# Altium schematic sheet Opamp-Sheet2.SchDoc
size A4; DocumentNumber: 2; SheetNumber: 11; SheetTotal: 12
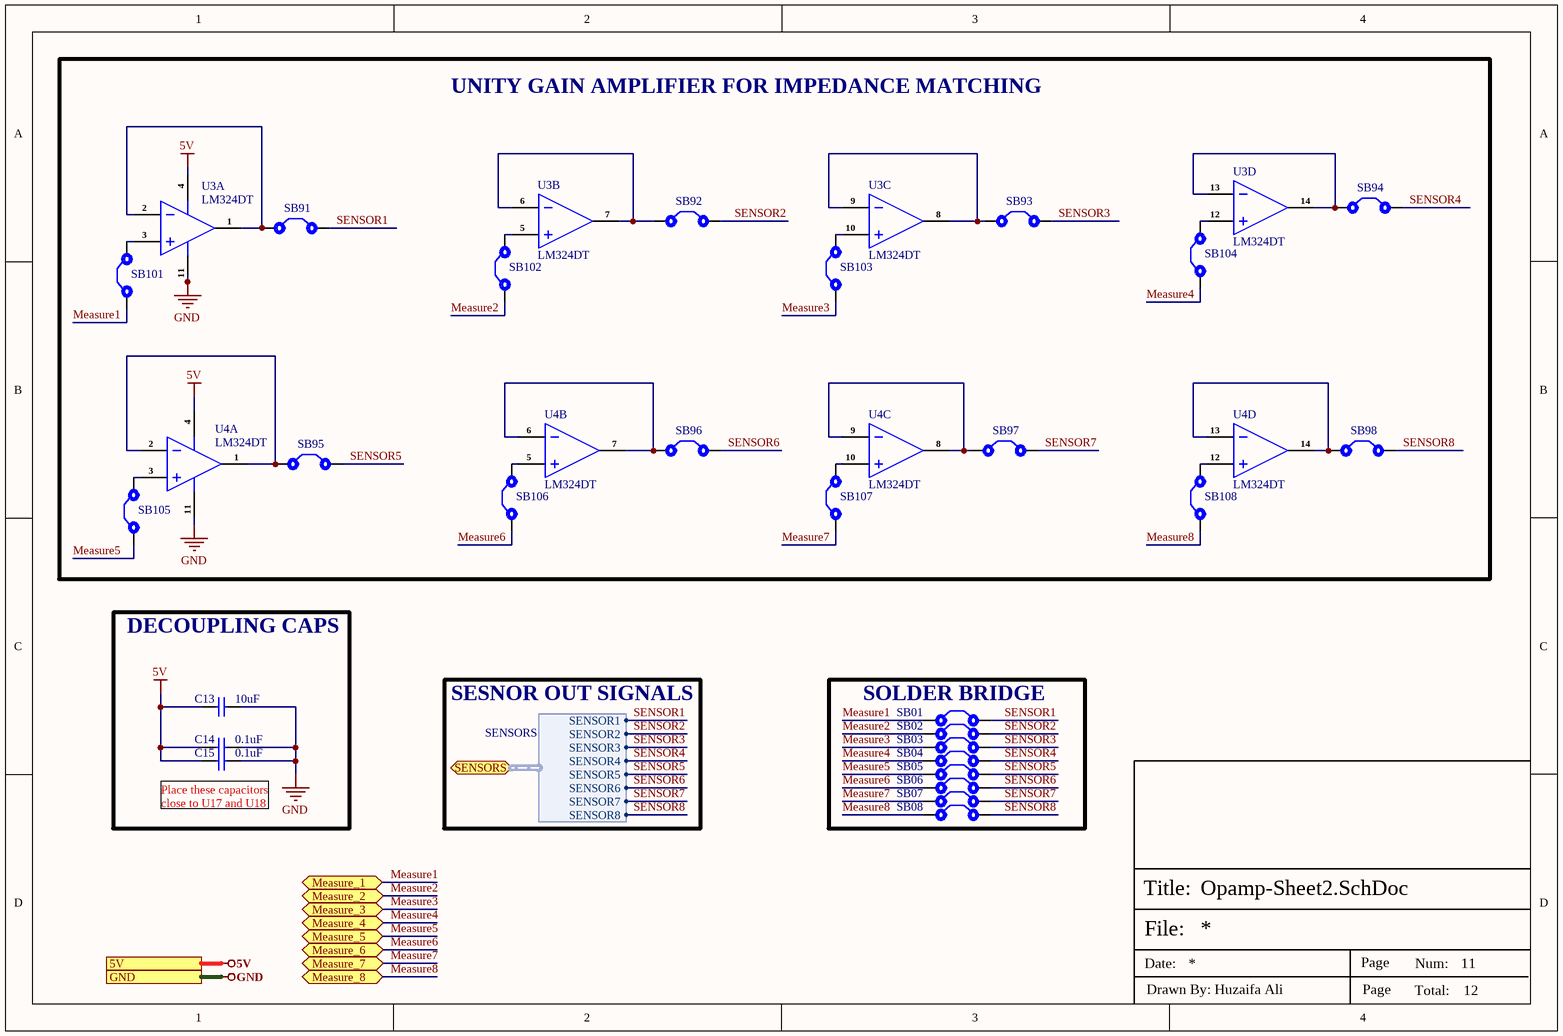
[diagram p0: Opamp-Sheet2.SchDoc]

## Parts
C13  10uF  [Cap-0603]
C14  0.1uF  [Cap-0402]
C15  0.1uF  [Cap-0402]
SB01  Solder Bridge 0402  [Solder Bridge 0402]  (value not drawn)  (no BOM)
SB02  Solder Bridge 0402  [Solder Bridge 0402]  (value not drawn)  (no BOM)
SB03  Solder Bridge 0402  [Solder Bridge 0402]  (value not drawn)  (no BOM)
SB04  Solder Bridge 0402  [Solder Bridge 0402]  (value not drawn)  (no BOM)
SB05  Solder Bridge 0402  [Solder Bridge 0402]  (value not drawn)  (no BOM)
SB06  Solder Bridge 0402  [Solder Bridge 0402]  (value not drawn)  (no BOM)
SB07  Solder Bridge 0402  [Solder Bridge 0402]  (value not drawn)  (no BOM)
SB08  Solder Bridge 0402  [Solder Bridge 0402]  (value not drawn)  (no BOM)
SB91  Solder Bridge 0402  [Solder Bridge 0402]  (value not drawn)  (no BOM)
SB92  Solder Bridge 0402  [Solder Bridge 0402]  (value not drawn)  (no BOM)
SB93  Solder Bridge 0402  [Solder Bridge 0402]  (value not drawn)  (no BOM)
SB94  Solder Bridge 0402  [Solder Bridge 0402]  (value not drawn)  (no BOM)
SB95  Solder Bridge 0402  [Solder Bridge 0402]  (value not drawn)  (no BOM)
SB96  Solder Bridge 0402  [Solder Bridge 0402]  (value not drawn)  (no BOM)
SB97  Solder Bridge 0402  [Solder Bridge 0402]  (value not drawn)  (no BOM)
SB98  Solder Bridge 0402  [Solder Bridge 0402]  (value not drawn)  (no BOM)
SB101  Solder Bridge 0402  [Solder Bridge 0402]  (value not drawn)  (no BOM)
SB102  Solder Bridge 0402  [Solder Bridge 0402]  (value not drawn)  (no BOM)
SB103  Solder Bridge 0402  [Solder Bridge 0402]  (value not drawn)  (no BOM)
SB104  Solder Bridge 0402  [Solder Bridge 0402]  (value not drawn)  (no BOM)
SB105  Solder Bridge 0402  [Solder Bridge 0402]  (value not drawn)  (no BOM)
SB106  Solder Bridge 0402  [Solder Bridge 0402]  (value not drawn)  (no BOM)
SB107  Solder Bridge 0402  [Solder Bridge 0402]  (value not drawn)  (no BOM)
SB108  Solder Bridge 0402  [Solder Bridge 0402]  (value not drawn)  (no BOM)
U3  LM324DT  [14-SO]  (parts A,B,C,D of 4)
U4  LM324DT  [14-SO]  (parts A,B,C,D of 4)

## Blocks framed on the sheet
UNITY GAIN AMPLIFIER FOR IMPEDANCE MATCHING: SB91-SB98 SB101-SB108 U3 U4
DECOUPLING CAPS: C13-C15
SOLDER BRIDGE: SB01 SB02 SB03 SB04 SB05 SB06 SB07 SB08

## Ports
5V (see Top-Sheet[2B], Electrode-Sheet1[3D], Electrode-Sheet2[3D], Electrode-Sheet3[3D], Electrode-Sheet4[3D], Electrode-Sheet5[3D], Electrode-Sheet6[3D], Electrode-Sheet7[3D], Electrode-Sheet8[3D], Power-Sheet[1D]), GND (see Top-Sheet[2B], Connector-Sheet[1D], Electrode-Sheet1[3D], Electrode-Sheet2[3D], Electrode-Sheet3[3D], Electrode-Sheet4[3D], Electrode-Sheet5[3D], Electrode-Sheet6[3D], Electrode-Sheet7[3D], Electrode-Sheet8[3D], Power-Sheet[1D]), Measure_1 (bidir, see Top-Sheet[2B]), Measure_2 (bidir, see Top-Sheet[2B]), Measure_3 (bidir, see Top-Sheet[2B]), Measure_4 (bidir, see Top-Sheet[2B]), Measure_5 (bidir, see Top-Sheet[2C]), Measure_6 (bidir, see Top-Sheet[2C]), Measure_7 (bidir, see Top-Sheet[2C]), Measure_8 (bidir, see Top-Sheet[2C]), SENSORS (bidir, harness SENSORS, see Top-Sheet[2B], Connector-Sheet[3A])

## Harnesses
SENSORS: SENSOR1, SENSOR2, SENSOR3, SENSOR4, SENSOR5, SENSOR6, SENSOR7, SENSOR8

## Nets
5V: C13.1 C14.1 C15.1 U3.4(VCC+) U4.4(VCC+) ; port 5V
GND: C13.2 C14.2 C15.2 U3.11(VCC-) U4.11(VCC-) ; port GND
Measure1: SB01.1 SB101.1 ; port Measure_1
Measure2: SB02.1 SB102.1 ; port Measure_2
Measure3: SB03.1 SB103.1 ; port Measure_3
Measure4: SB04.1 SB104.1 ; port Measure_4
Measure5: SB05.1 SB105.1 ; port Measure_5
Measure6: SB06.1 SB106.1 ; port Measure_6
Measure7: SB07.1 SB107.1 ; port Measure_7
Measure8: SB08.1 SB108.1 ; port Measure_8
SENSOR1: SB01.2 SB91.2 ; port SENSORS.SENSOR1
SENSOR2: SB02.2 SB92.2 ; port SENSORS.SENSOR2
SENSOR3: SB03.2 SB93.2 ; port SENSORS.SENSOR3
SENSOR4: SB04.2 SB94.2 ; port SENSORS.SENSOR4
SENSOR5: SB05.2 SB95.2 ; port SENSORS.SENSOR5
SENSOR6: SB06.2 SB96.2 ; port SENSORS.SENSOR6
SENSOR7: SB07.2 SB97.2 ; port SENSORS.SENSOR7
SENSOR8: SB08.2 SB98.2 ; port SENSORS.SENSOR8
NetSB91_1: SB91.1 U3.1(1OUT) U3.2(IN-)
NetSB92_1: SB92.1 U3.6(2IN-) U3.7(2OUT)
NetSB93_1: SB93.1 U3.8(3OUT) U3.9(3IN-)
NetSB94_1: SB94.1 U3.13(4IN-) U3.14(4OUT)
NetSB95_1: SB95.1 U4.1(1OUT) U4.2(IN-)
NetSB96_1: SB96.1 U4.6(2IN-) U4.7(2OUT)
NetSB97_1: SB97.1 U4.8(3OUT) U4.9(3IN-)
NetSB98_1: SB98.1 U4.13(4IN-) U4.14(4OUT)
NetSB101_2: SB101.2 U3.3(IN+)
NetSB102_2: SB102.2 U3.5(2IN+)
NetSB103_2: SB103.2 U3.10(3IN+)
NetSB104_2: SB104.2 U3.12(4IN+)
NetSB105_2: SB105.2 U4.3(IN+)
NetSB106_2: SB106.2 U4.5(2IN+)
NetSB107_2: SB107.2 U4.10(3IN+)
NetSB108_2: SB108.2 U4.12(4IN+)

## Notes on the sheet
- SESNOR OUT SIGNALS
- Place these capacitors close to U17 and U18
- File:
- Title:
- Date:
- Page
- Num:
- Total:
- Drawn By: Huzaifa Ali

## Library data of the parts
C13 = CL10A106MA8NRNC: CAP CER 10UF 25V X5R 0603; Manufacturer: Samsung; Tolerance: 20%; Supplier 1: Avnet; Manufacturer Part Number: CL10A106MA8NRNC; RoHS: Yes; Category: Ceramic Capacitors; Pricing 1: 4000=0.03753, 8000=0.03700, 16000=0.03595, 24000=0.03515, 32000=0.03383, 40000=0.03304, 400000=0.03225 (USD); Mount: Surface Mount; Case/Package: 0603; Case Code (Metric): 1608; Case Code (Imperial): 0603; Contact Plating: Tin; Min Operating Temperature: -55°C; Max Operating Temperature: 85°C; Package Quantity: 1; Packaging: Tape and Reel; Capacitance: 10uF; Voltage Rating: 25V; Dielectric: X5R; Termination: Wraparound; Series: CL; Construction: Flat; Length: 0.063inch; Width: 0.031inch; Thickness: 0.035inch; Lead Free: Lead Free; RoHS Compliant: Yes; ComponentLink1URL: https://datasheet.ciiva.com/25766/cl10a106ma8nrnc-25766562.pdf?src-supplier=Digi-Key; ComponentLink1Description: https://datasheet.ciiva.com/25766/cl10a106ma8nrnc-25766562.pdf?src-supplier=Digi-Key; Supplier Part Number 1: CL10A106MA8NRNC; LCSC Part Number: C96446
C14 C15 = GRM155R71H104ME14D: CAP CER 0.1UF 50V X7R 0402; Manufacturer: Murata; Tolerance: 20%; Capacitance: 100nF; Item Type: Capacitor; Supplier 1: Avnet; Manufacturer Part Number: GRM155R71H104ME14D; Stock 1: 100000; Pricing 1: 10000=0.00444, 20000=0.00420, 40000=0.00396, 60000=0.00372, 80000=0.00348, 100000=0.00324, 1000000=0.00300 (USD); Mount: Surface Mount; Case/Package: 0402; Min Operating Temperature: -55°C; Max Operating Temperature: 125°C; Packaging: Cut Tape; Voltage Rating: 50V; Length: 0.039inch; Width: 0.02inch; Thickness: 0.022inch; ComponentLink1URL: http://www.mouser.com/ds/2/281/c02e-2905.pdf?src-supplier=Mouser; ComponentLink1Description: http://www.mouser.com/ds/2/281/c02e-2905.pdf?src-supplier=Mouser; ComponentLink2URL: http://search.murata.co.jp/Ceramy/image/img/A01X/G101/ENG/GRM155R71H104ME14-01.pdf?src-supplier=Digi-Key; ComponentLink2Description: http://search.murata.co.jp/Ceramy/image/img/A01X/G101/ENG/GRM155R71H104ME14-01.pdf?src-supplier=Digi-Key; ComponentLink3URL: http://psearch.en.murata.com/capacitor/product/GRM155R71H104ME14%23.pdf?src-supplier=Avnet; ComponentLink3Description: http://psearch.en.murata.com/capacitor/product/GRM155R71H104ME14%23.pdf?src-supplier=Avnet; Supplier Part Number 1: GRM155R71H104ME14D; RoHS: Yes; Category: Ceramic Capacitors; RoHS Compliant: Yes; LCSC Part Number: C182412
SB01 SB02 SB03 SB04 SB05 SB06 SB07 SB08 SB91-SB98 SB101-SB108 = Solder Bridge 0402: Solder Bridge ON; Manufacturer Part Number: Solder Bridge 0402; Item Type: Solder Bridge
U3 U4 = LM324DT: IC OPAMP GP 1.3MHZ 14SO; Manufacturer: STMicroelectronics; Max Supply Voltage: 30V; Min Supply Voltage: 3V; Min Dual Supply Voltage: 1.5V; Max Dual Supply Voltage: 15V; Voltage Gain: 100dB; Slew Rate: 0.4V/µs; Common Mode Rejection Ratio: 70dB; Nominal Supply Current: 1.2mA; Input Offset Voltage (Vos): 7mV; Input Bias Current: 150nA; Number of Circuits: 4; Output Current per Channel: 40mA; Dual Supply Voltage: 12V; Supply Type: Single,Dual; Input Voltage Noise Density: 40nV/sqrt Hz; Max Power Dissipation: 400mW; Supplier 1: Arrow Electronics; Manufacturer Part Number: LM324DT; RoHS: Yes; Stock 1: 287500; Pricing 1: 2500=0.18900 (USD); Mount: Surface Mount; Case/Package: SO; Number of Pins: 14; Contact Plating: Tin,Matte; Weight: 0.009143oz; Min Operating Temperature: 0°C; Max Operating Temperature: 70°C; Gain Bandwidth Product: 1.3MHz; Packaging: Cut Tape; Package Quantity: 2500; Operating Supply Current: 1.2mA; Operating Supply Voltage: 15V; Number of Channels: 4; Output Current: 40mA; Number of Elements: 4; Series: LM324; Technology: BIPOLAR; Bandwidth: 1.3MHz; Number of Amplifiers: 4; Unity Gain Bandwidth Product: 1.3MHz; Width: 4mm; Height: 1.65mm; Radiation Hardening: No; RoHS Compliant: Yes; Lead Free: Lead Free; REACH SVHC: No SVHC; ComponentLink1URL: https://datasheet.ciiva.com/4758/cd00000457-103203-4758032.pdf?src-supplier=Mouser; ComponentLink1Description: https://datasheet.ciiva.com/4758/cd00000457-103203-4758032.pdf?src-supplier=Mouser; ComponentLink2URL: https://datasheet.ciiva.com/8008/1834360-8008827.pdf?src-supplier=Element14; ComponentLink2Description: https://datasheet.ciiva.com/8008/1834360-8008827.pdf?src-supplier=Element14; ComponentLink3URL: https://datasheet.ciiva.com/8008/1834360-8008490.pdf?src-supplier=Element14; ComponentLink3Description: https://datasheet.ciiva.com/8008/1834360-8008490.pdf?src-supplier=Element14; ComponentLink4URL: https://datasheet.ciiva.com/28630/1834360-28630538.pdf?src-supplier=Element14; ComponentLink4Description: https://datasheet.ciiva.com/28630/1834360-28630538.pdf?src-supplier=Element14; ComponentLink5URL: https://datasheet.ciiva.com/1795/cd00000457-1795560.pdf?src-supplier=Digi-Key; ComponentLink5Description: https://datasheet.ciiva.com/1795/cd00000457-1795560.pdf?src-supplier=Digi-Key; ComponentLink6URL: https://datasheet.ciiva.com/1795/cd00000457-1795559.pdf?src-supplier=Digi-Key; ComponentLink6Description: https://datasheet.ciiva.com/1795/cd00000457-1795559.pdf?src-supplier=Digi-Key; ComponentLink7URL: https://datasheet.ciiva.com/1795/cd00000457-1795561.pdf?src-supplier=Digi-Key; ComponentLink7Description: https://datasheet.ciiva.com/1795/cd00000457-1795561.pdf?src-supplier=Digi-Key; ComponentLink8URL: https://datasheet.ciiva.com/16375/cd00000457-16375528.pdf?src-supplier=Future+Electronics; ComponentLink8Description: https://datasheet.ciiva.com/16375/cd00000457-16375528.pdf?src-supplier=Future+Electronics; Supplier Part Number 1: LM324DT; LCSC Part Number: C71035; Item Type: IC